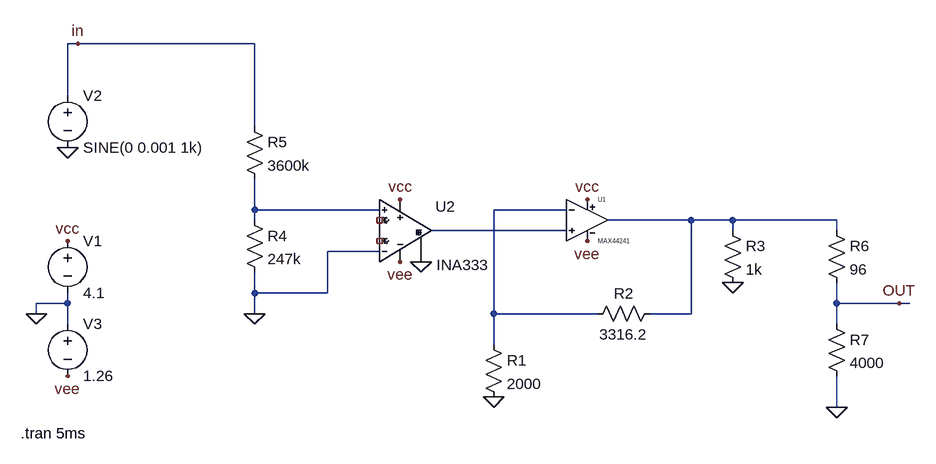
[diagram p0: schematic dc_load_sensing_max44241.asc]
dc_load_sensing_max44241.asc, the LTspice schematic file:
Version 4
SHEET 1 880 680
WIRE -576 -128 -592 -128
WIRE -304 -128 -576 -128
WIRE -592 -48 -592 -128
WIRE -304 0 -304 -128
WIRE -304 128 -304 80
WIRE -112 128 -304 128
WIRE 176 128 64 128
WIRE -304 144 -304 128
WIRE 368 144 240 144
WIRE 432 144 368 144
WIRE 592 144 432 144
WIRE 176 160 -32 160
WIRE 432 160 432 144
WIRE 592 160 592 144
WIRE -112 192 -192 192
WIRE -304 256 -304 224
WIRE -192 256 -192 192
WIRE -192 256 -304 256
WIRE -592 272 -592 256
WIRE -592 272 -640 272
WIRE 592 272 592 240
WIRE 688 272 592 272
WIRE 704 272 688 272
WIRE -640 288 -640 272
WIRE -304 288 -304 256
WIRE 64 288 64 128
WIRE 224 288 64 288
WIRE 368 288 368 144
WIRE 368 288 304 288
WIRE -592 304 -592 272
WIRE 592 304 592 272
WIRE 64 336 64 288
WIRE 592 432 592 384
FLAG -640 288 0
FLAG -592 176 vcc
FLAG 208 112 vcc
FLAG 208 176 vee
FLAG -592 384 vee
FLAG -592 32 0
FLAG 432 240 0
FLAG 64 416 0
FLAG -576 -128 in
FLAG -80 112 vcc
FLAG -80 208 vee
FLAG -48 208 0
FLAG -304 288 0
FLAG 592 432 0
FLAG 688 272 OUT
SYMBOL MAX44241 208 80 R0
SYMATTR InstName U1
SYMBOL res 48 320 R0
SYMATTR InstName R1
SYMATTR Value 2000
SYMBOL res 320 272 R90
WINDOW 0 0 56 VBottom 2
WINDOW 3 32 56 VTop 2
SYMATTR InstName R2
SYMATTR Value 3316.2
SYMBOL voltage -592 160 R0
WINDOW 123 0 0 Left 2
WINDOW 39 0 0 Left 2
SYMATTR InstName V1
SYMATTR Value 4.1
SYMBOL voltage -592 -64 R0
WINDOW 123 0 0 Left 2
WINDOW 39 0 0 Left 2
SYMATTR InstName V2
SYMATTR Value SINE(0 0.001 1k)
SYMBOL voltage -592 288 R0
WINDOW 123 0 0 Left 2
WINDOW 39 0 0 Left 2
SYMATTR InstName V3
SYMATTR Value 1.26
SYMBOL res 416 144 R0
SYMATTR InstName R3
SYMATTR Value 1k
SYMBOL res -320 128 R0
SYMATTR InstName R4
SYMATTR Value 247k
SYMBOL res -320 -16 R0
SYMATTR InstName R5
SYMATTR Value 3600k
SYMBOL res 576 144 R0
SYMATTR InstName R6
SYMATTR Value 96
SYMBOL res 576 288 R0
SYMATTR InstName R7
SYMATTR Value 4000
SYMBOL my\\INA333 -80 160 R0
SYMATTR InstName U2
TEXT -664 472 Left 2 !.tran 5ms

The netlist it stands for:
* dc_load_sensing_max44241.asc
XU1 N004 N002 vcc vee N003 MAX44241  ; pins INA+ INA- VDD VSS OUTA
R1 N002 0 2000
R2 N003 N002 3316.2
V1 vcc 0 4.1
V2 in 0 SINE(0 0.001 1k)
V3 0 vee 1.26
R3 N003 0 1k
R4 N001 0 247k
R5 in N001 3600k
R6 N003 OUT 96
R7 OUT 0 4000
XU2 NC_01 N001 0 vee 0 N004 vcc NC_02 INA333  ; pins RG+ VIN+ VIN- V- REF VOUT V+ RG-
.tran 5ms
.lib MAX44241.lib
.lib INA333.lib
.backanno
.end